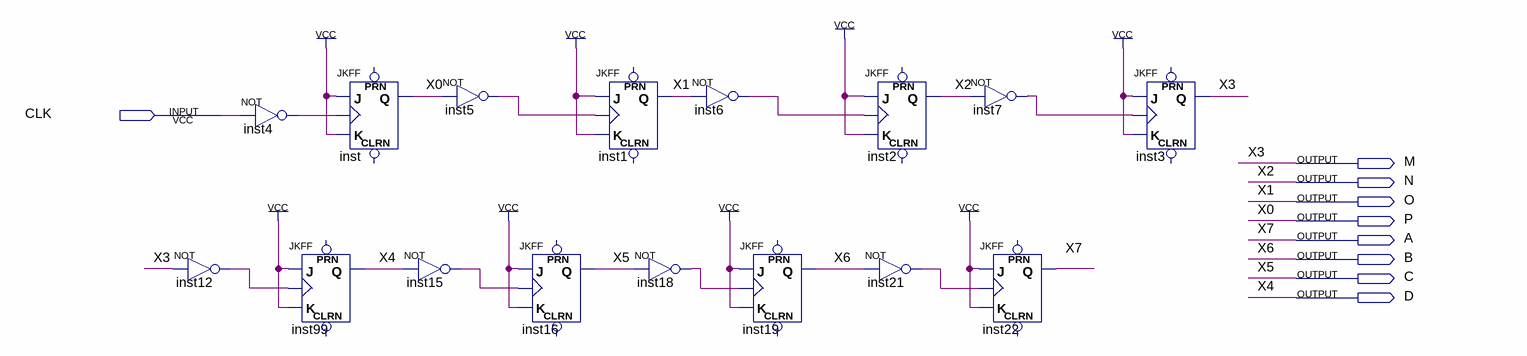
[diagram p0: schematic sheet]
// Quartus schematic Contador_Cresc.bdf as structural Verilog: 16 symbols, 9 pins
module Contador_Cresc (
  input  CLK,
  output M,
  output N,
  output O,
  output P,
  output A,
  output B,
  output C,
  output D
);

  wire inst4_out, inst5_out, inst6_out, inst7_out, inst12_out, inst15_out, inst18_out, inst21_out;

  not inst12 (inst12_out, M);
  not inst4 (inst4_out, CLK);
  JKFF inst (.K(1'b1), .J(1'b1), .CLK(inst4_out), .Q(P));  // open: PRN, CLRN
  JKFF inst99 (.K(1'b1), .J(1'b1), .CLK(inst12_out), .Q(D));  // open: PRN, CLRN
  not inst15 (inst15_out, D);
  not inst5 (inst5_out, P);
  JKFF inst16 (.K(1'b1), .J(1'b1), .CLK(inst15_out), .Q(C));  // open: PRN, CLRN
  JKFF inst1 (.K(1'b1), .J(1'b1), .CLK(inst5_out), .Q(O));  // open: PRN, CLRN
  not inst18 (inst18_out, C);
  not inst6 (inst6_out, O);
  JKFF inst19 (.K(1'b1), .J(1'b1), .CLK(inst18_out), .Q(B));  // open: PRN, CLRN
  JKFF inst2 (.K(1'b1), .J(1'b1), .CLK(inst6_out), .Q(N));  // open: PRN, CLRN
  not inst21 (inst21_out, B);
  not inst7 (inst7_out, N);
  JKFF inst22 (.K(1'b1), .J(1'b1), .CLK(inst21_out), .Q(A));  // open: PRN, CLRN
  JKFF inst3 (.K(1'b1), .J(1'b1), .CLK(inst7_out), .Q(M));  // open: PRN, CLRN

  // Other names for the same wires on the sheet: X0 = P; X1 = O; X2 = N; X3 = M; X4 = D; X5 = C; X6 = B; X7 = A
endmodule
